# EasyEDA Pro project RT1064主板.eprj

# Schematic Schematic1
Board Name: Board1; Create Date: 2025-12-27; Page Name: P1; Project Name: 雪豹队 - 副本; Schematic Name: Schematic1; Update Date: 2025-12-29; Company: 嘉立创EDA; Page Size: A4; Version: V1.0
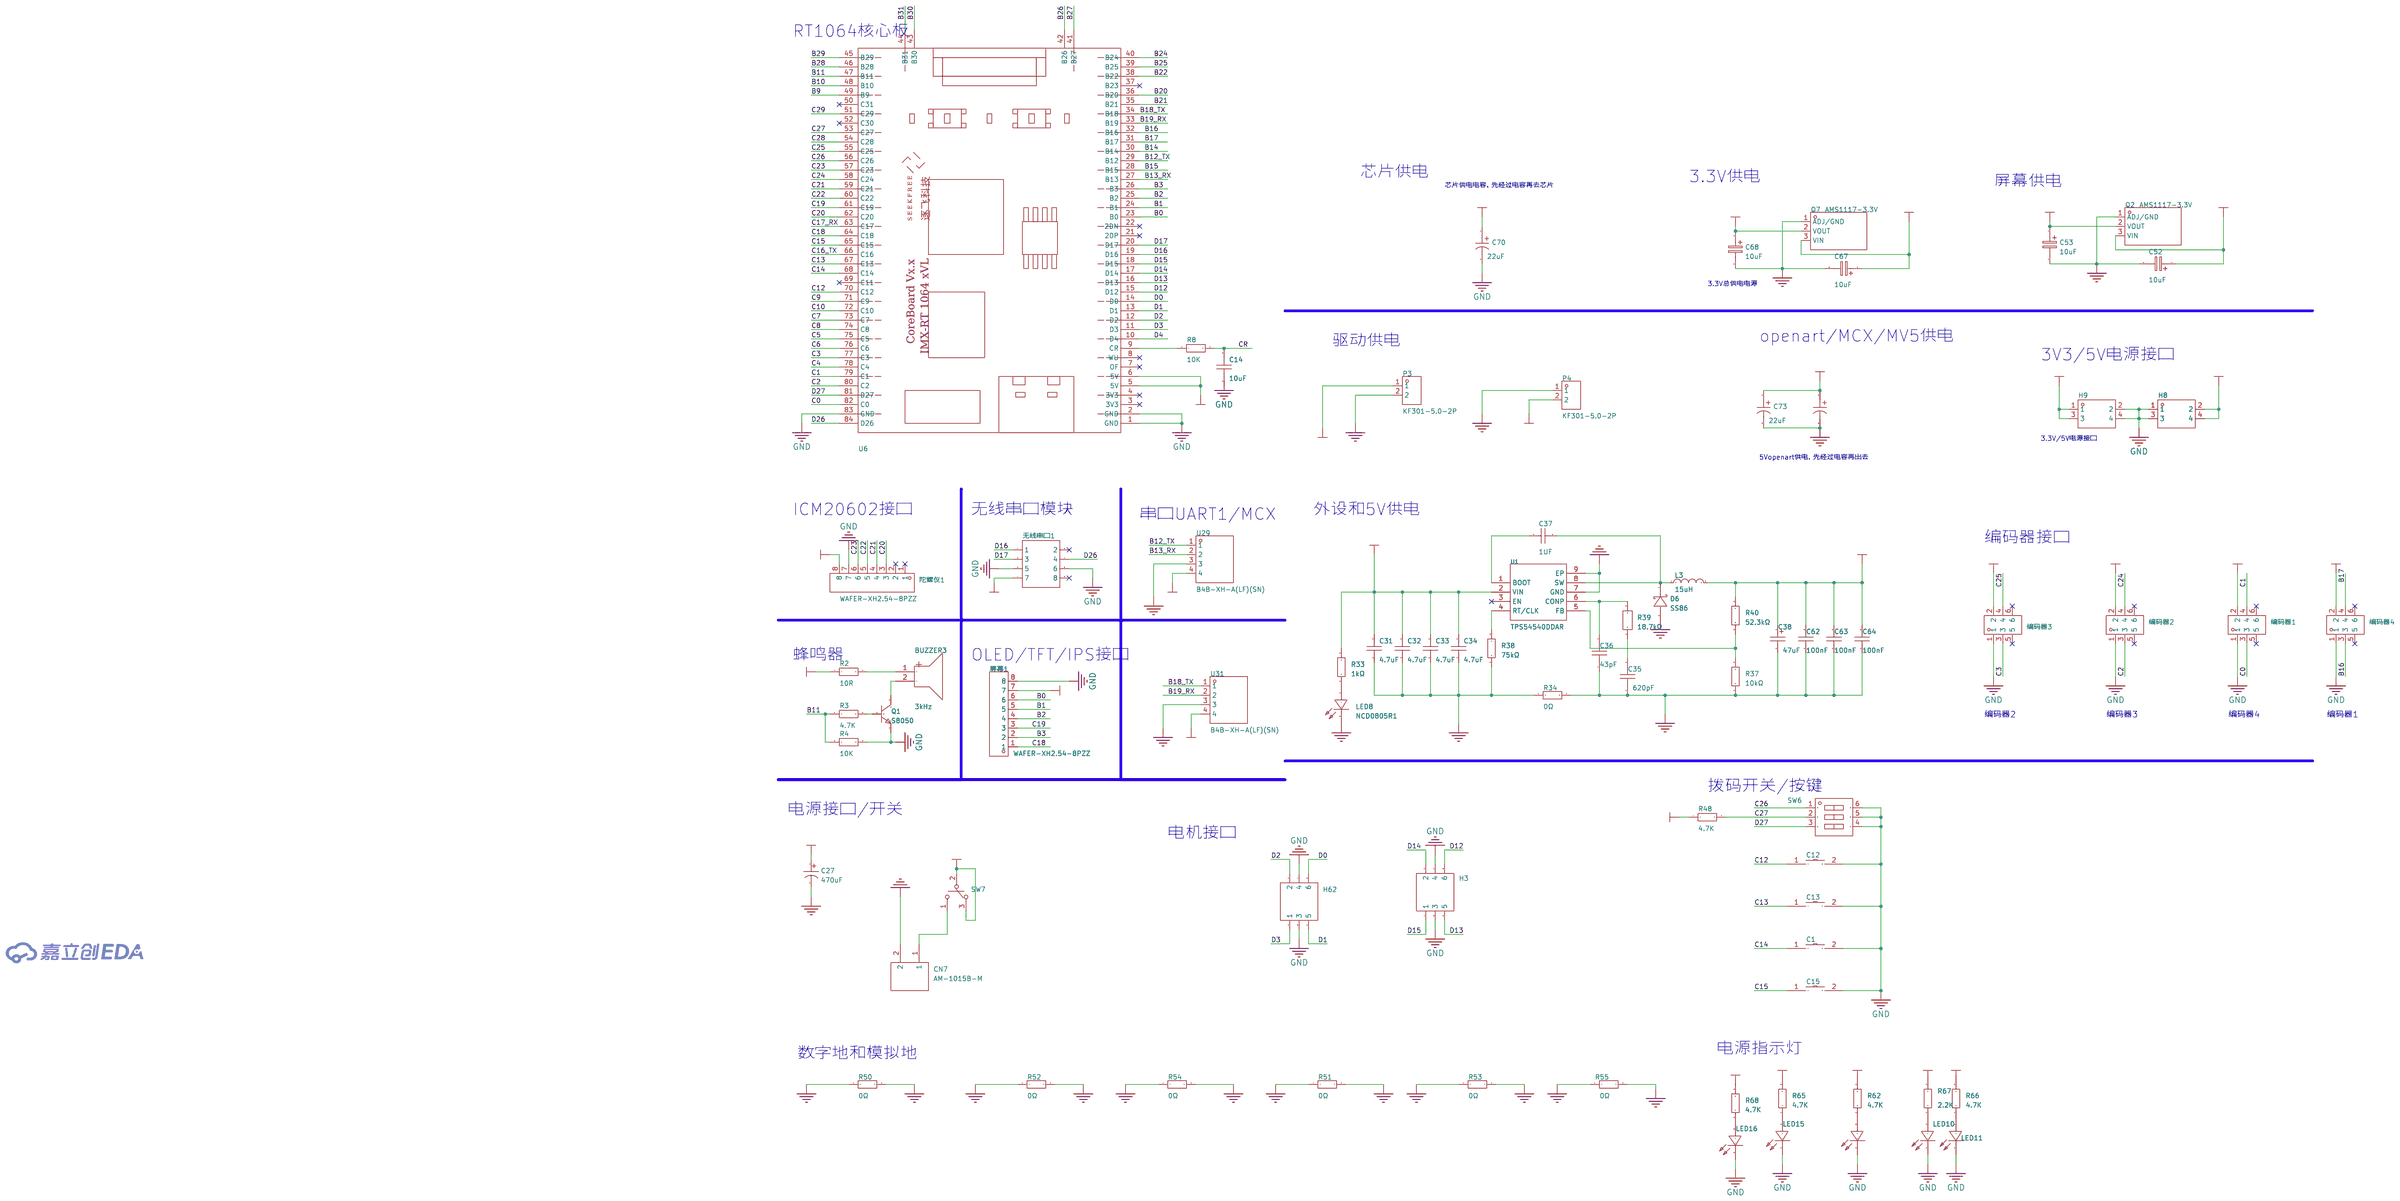
[diagram p0: schematic sheet]

## Parts
BUZZER3  3kHz  [BUZ-TH_BD9.0-P5.00-D0.6-FD]
C1  TS-1101-C-W  [SW-SMD_L6.0-W3.3-LS8.0]
C12  TS-1101-C-W  [SW-SMD_L6.0-W3.3-LS8.0]
C13  TS-1101-C-W  [SW-SMD_L6.0-W3.3-LS8.0]
C14  10uF  [C0805]
C15  TS-1101-C-W  [SW-SMD_L6.0-W3.3-LS8.0]
C27  470uF  [CAP-TH_BD10.0-P5.00-D1.0-FD]
C31  4.7uF  [C0805]
C32  4.7uF  [C0805]
C33  4.7uF  [C0805]
C34  4.7uF  [C0805]
C35  620pF  [C0805]
C36  43pF  [C0805]
C37  1UF  [C0805]
C38  47uF  [CAP-SMD_L3.5-W2.8-R-RD]
C52  10uF  [CAP-SMD_L3.5-W2.8-R-RD]
C53  10uF  [CAP-SMD_L3.5-W2.8-R-RD]
C62  100nF  [C0805]
C63  100nF  [C0805]
C64  100nF  [C0805]
C67  10uF  [CAP-SMD_L3.5-W2.8-R-RD]
C68  10uF  [CAP-SMD_L3.5-W2.8-R-RD]
C70  22uF  [CAP-SMD_L3.2-W1.6]
C73  22uF  [CAP-SMD_L3.2-W1.6]
C81  22uF  [CAP-SMD_L3.2-W1.6]
CN7  AM-1015B-M  [CONN-TH_AM-1015B-M]
D6  SS86  [SMC_L6.9-W5.9-LS7.9-RD]
H3  -  [HDR-TH_6P-P2.54-V-F-R2-C3-S2.54]
H8  -  [HDR-TH_4P-P2.54-V-M-R2-C2-S2.54-1]
H9  -  [HDR-TH_4P-P2.54-V-M-R2-C2-S2.54-1]
H62  -  [HDR-TH_6P-P2.54-V-F-R2-C3-S2.54]
L3  15uH  [IND-SMD_L7.1-W6.6]
LED8  NCD0805R1  [LED0805-R-RD]
LED10  NCD0805R1  [LED0805-RD]
LED11  NCD0805R1  [LED0805-RD]
LED12  NCD0805R1  [LED0805-RD]
LED15  NCD0805R1  [LED0805-RD]
LED16  NCD0805R1  [LED0805-RD]
P3  KF301-5.0-2P  [CONN-TH_P5.00_KF301-5.0-2P]
P4  KF301-5.0-2P  [CONN-TH_P5.00_KF301-5.0-2P]
Q1  S8050  [SOT-23-3_L2.9-W1.3-P1.90-LS2.4-BR]
Q2  AMS1117-3.3V  [SOT-89-3_L4.5-W2.5-P1.50-LS4.2-BR]
Q7  AMS1117-3.3V  [SOT-89-3_L4.5-W2.5-P1.50-LS4.2-BR]
R2  10R  [R0805]
R3  4.7K  [R0805]
R4  10K  [R0805]
R8  10K  [R0805]
R33  1kΩ  [R0805]
R34  0Ω  [R0805]
R37  10kΩ  [R0805]
R38  75kΩ  [R0805]
R39  18.7kΩ  [R0805]
R40  52.3kΩ  [R0805]
R48  4.7K  [R0805]
R50  0Ω  [R0805]
R51  0Ω  [R0805]
R52  0Ω  [R0805]
R53  0Ω  [R0805]
R54  0Ω  [R0805]
R55  0Ω  [R0805]
R62  4.7K  [R0805]
R65  4.7K  [R0805]
R66  4.7K  [R0805]
R67  2.2K  [R0805]
R68  4.7K  [R0805]
SW6  KF1001-03P-R0-GL-DFT-01B  [SW-TH_6P-L9.9-W9.0-P2.54-LS7.6]
SW7  MT-0-103-A101-M200-RS+PJ  [SW-TH_MT-0-103-A101-M200-RS]
U1  TPS54540DDAR  [SOIC-8_L4.9-W3.9-P1.27-LS6.0-BL-EP]
U6  -  [AUFE_RT1064]
U29  B4B-XH-A(LF)(SN)  [CONN-TH_B4B-XH-A-LF-SN]
U31  B4B-XH-A(LF)(SN)  [CONN-TH_B4B-XH-A-LF-SN]
屏幕1  WAFER-XH2.54-8PZZ  [CONN-TH_8P-P2.50-XH2.54-8P]
无线串口1  -  [HDR-TH_8P-P2.54-V-F-R2-C4-S2.54-1]
编码器1  67997-206HLF  [HDR-TH_6P-P2.54-V-M-R2-C3-S2.54-1]
编码器2  67997-206HLF  [HDR-TH_6P-P2.54-V-M-R2-C3-S2.54-1]
编码器3  67997-206HLF  [HDR-TH_6P-P2.54-V-M-R2-C3-S2.54-1]
编码器4  67997-206HLF  [HDR-TH_6P-P2.54-V-M-R2-C3-S2.54-1]
陀螺仪1  WAFER-XH2.54-8PZZ  [CONN-TH_8P-P2.50-XH2.54-8P]

## Library data of the parts
BUZZER3 = HNB09A03: 驱动方式:有源(内含驱动线路);构造类型:电磁式;频率:3kHz;声压(SPL):85dB@10cm;; LCSC Part Name: 电磁式有源一体蜂鸣器HNB09A03; Supplier Part: C96102; Manufacturer: 华能; Supplier Footprint: 插件,D=9mm; JLCPCB Part Class: 扩展库; Datasheet: https://atta.szlcsc.com/upload/public/pdf/source/20170522/1495448326172.pdf; Supplier: LCSC; Oscillator Circuit: 有源(内含驱动线路); Technology Type: 电磁式; Operating Voltage: 1.5V~4.5V; Current Consumption: 30mA; Sound Pressure Level (SPL): 85dB@10cm; Diameter (φD): 9mm; Height: 5.5mm; Operating Temperature: -20℃~+70℃
C1 C12 C13 C15 = TS-1101-C-W: 触点电流:50mA;额定电压(DC):12V;绝缘电阻:-;电路结构:单刀单掷;安装方式:立贴;按钮形状:矩形按钮;按钮/盖帽颜色:白色;带灯:无;作用力:260gf;机械寿命:50000;工作温度:-30℃~+85℃;开关长度:6mm;开关宽度:3.6mm;开关高度:2.5mm;带支架:否;; LCSC Part Name: TS-1101-C-W 一型3*6*2.5有白ZD b拉伸白色按键 卷装; Supplier Part: C318938; Manufacturer: XKB Connectivity(中国星坤); Supplier Footprint: SMD; JLCPCB Part Class: Extended Part; Datasheet: https://atta.szlcsc.com/upload/public/pdf/source/20200227/C318938_C2E53B1EEDE37D980A33616AC086DE53.pdf; Supplier: LCSC; Contact Current: 50mA; Voltage Rating (DC): 12V; Circuit: 单刀单掷; Mounting Style: 立贴; Actuator Style: 矩形按钮; Actuator/Cap Color: 白色; With Lamp: 无; Operating Force: 260gf; Mechanical Life: 50000; Operating Temperature: -30℃~+85℃; Switch Length: 6mm; Switch Width: 3.6mm; Switch Height: 2.5mm; Strike Gundam: 否
C14 = CAP_0805: Supplier Footprint: 0805
C27 = KM477M050G20RR0VH2FP0: 容值:470uF;精度:±20%;额定电压:50V;电容体直径:10mm;电容体长度:20mm;脚间距:5mm;工作寿命:2000hrs@105℃;; LCSC Part Name: 470uF ±20% 50V; Supplier Part: C34642; Manufacturer: CX(承兴); Supplier Footprint: 直插,D10xL20mm; JLCPCB Part Class: Extended Part; Datasheet: https://atta.szlcsc.com/upload/public/pdf/source/20211027/06D6BA3719C264B639DC286D935D03EA.pdf; Supplier: LCSC; Tolerance: ±20%; Rated Voltage: 50V; φD: 10mm; L: 20mm; Lead Spacing: 5mm; Lifetime @ Temp: 2000hrs@105℃
C31-C34 = CL21A475KAQNNNE: 容值:4.7uF;精度:±10%;额定电压:25V;材质(温度系数):X5R;; LCSC Part Name: 4.7uF ±10% 25V; Supplier Part: C1779; Manufacturer: SAMSUNG(三星); Supplier Footprint: 0805; JLCPCB Part Class: 基础库; Datasheet: https://atta.szlcsc.com/upload/public/pdf/source/20160218/1457707763339.pdf; Supplier: LCSC; Tolerance: ±10%; Voltage Rated: 25V; Temperature Coefficient: X5R
C35 = CC0805FRNPO9BN621: 容值:620pF;精度:±1%;额定电压:50V;材质(温度系数):NP0;; LCSC Part Name: 620pF ±1% 50V; Supplier Part: C541568; Manufacturer: YAGEO(国巨); Supplier Footprint: 0805; JLCPCB Part Class: 扩展库; Datasheet: https://atta.szlcsc.com/upload/public/pdf/source/20200615/C541568_5E136F40411BB8460285BCFF982D8614.pdf; Supplier: LCSC; Tolerance: ±1%; Voltage Rated: 50V; Temperature Coefficient: NP0
C36 = 0805CG430J500NT: 容值:43pF;精度:±5%;额定电压:50V;材质(温度系数):C0G;; LCSC Part Name: 43pF ±5% 50V; Supplier Part: C502147; Manufacturer: FH(风华); Supplier Footprint: 0805; JLCPCB Part Class: 扩展库; Datasheet: https://atta.szlcsc.com/upload/public/pdf/source/20200305/C486355_26A10D38EF8C2A5C37091D0039909270.pdf; Supplier: LCSC; Tolerance: ±5%; Voltage Rated: 50V; Temperature Coefficient: C0G
C37 = CC0805KRX7R9BB104: 容值:100nF;精度:±10%;额定电压:50V;材质(温度系数):X7R;; LCSC Part Name: 100nF ±10% 50V; Supplier Part: C49678; Manufacturer: YAGEO(国巨); Supplier Footprint: 0805; JLCPCB Part Class: 基础库; Datasheet: https://atta.szlcsc.com/upload/public/pdf/source/20180224/C181747_15194369449651363981.pdf; Supplier: LCSC; Tolerance: ±10%; Voltage Rated: 50V; Temperature Coefficient: X7R
C38 = CA45-B010K476T: 容值:47uF;精度:±10%;额定电压:10V;等效串联电阻:1Ω@100kHz;; LCSC Part Name: 47uF ±10% 10V; Supplier Part: C123253; Manufacturer: 湘怡中元/湘江; Supplier Footprint: CASE-B-3528; JLCPCB Part Class: 扩展库; Datasheet: https://atta.szlcsc.com/upload/public/pdf/source/20181017/C123253_E44F021CD80332E438026884F943F9F2.pdf; Supplier: LCSC; Tolerance: ±10%; Rated Voltage: 10V; Equivalent Series Resistance(ESR): 1Ω@100kHz; Operating Temperature: -55℃~+125℃
C52 C53 C67 C68 = CA45-B-16V-10μF-K: 容值:10uF;精度:±10%;额定电压:16V;等效串联电阻:2.8Ω@100kHz;; LCSC Part Name: 10uF ±10% 16V; Supplier Part: C503899; Manufacturer: TORCH(火炬); Supplier Footprint: CASE-B-3528; JLCPCB Part Class: 扩展库; Datasheet: https://atta.szlcsc.com/upload/public/pdf/source/20200527/C503899_E68A547A52C2BA3860090FD06476D5DC.pdf; Supplier: LCSC; Tolerance: ±10%; Rated Voltage: 16V; Equivalent Series Resistance(ESR): 2.8Ω@100kHz; Operating Temperature: -55℃~+125℃
C62-C64 = 0805B104K500NT: 容值:100nF;精度:±10%;额定电压:50V;材质(温度系数):X7R;; LCSC Part Name: 100nF ±10% 50V; Supplier Part: C38141; Manufacturer: FH(风华); Supplier Footprint: 0805; JLCPCB Part Class: 扩展库; Datasheet: https://atta.szlcsc.com/upload/public/pdf/source/20200305/C486355_26A10D38EF8C2A5C37091D0039909270.pdf; Supplier: LCSC; Tolerance: ±10%; Voltage Rated: 50V; Temperature Coefficient: X7R
C70 C73 C81 = CA45-A-16V-22uF-K: 容值:22uF;精度:±10%;额定电压:16V;等效串联电阻:6Ω@100kHz;; LCSC Part Name: 22uF ±10% 16V; Supplier Part: C782264; Manufacturer: CEC(振华新云); Supplier Footprint: CASE-A-3216; JLCPCB Part Class: 扩展库; Datasheet: https://atta.szlcsc.com/upload/public/pdf/source/20200909/C782264_D6D9C4EF3B25E81633C26A9294FBB820.pdf; Supplier: LCSC; Tolerance: ±10%; Rated Voltage: 16V; Equivalent Series Resistance(ESR): 6Ω@100kHz; Operating Temperature: -55℃~+125℃
CN7 = AM-1015B-M: 类别:-;类型1:-;; LCSC Part Name: AMASS(艾迈斯)电源连接器公头AM-1015B-M; Supplier Part: C90631; Manufacturer: AMASS(艾迈斯); JLCPCB Part Class: 扩展库; Datasheet: https://atta.szlcsc.com/upload/public/pdf/source/20161217/1481939174683.pdf; Supplier: LCSC; Brand: 艾迈斯; Type: T行插头; RatedVoltage: DC 500V; InterfaceType: 双公头; MetalMaterial: 铜镀金; InsulationMaterial: PA; RatedCurrent: 25A; RecommendedWireGauge: 12AWG; FlameRetardantGrade: UL94 V0; contact resistance: 0.45mΩ
D6 = SS86: 二极管配置:独立式;正向压降(Vf):700mV@8A;直流反向耐压(Vr):60V;平均整流电流(Io):8A;; LCSC Part Name: 电压:60V 电流:8A; Supplier Part: C698827; Manufacturer: YANGJIE(扬杰); Supplier Footprint: SMC(DO-214AB); JLCPCB Part Class: 扩展库; Datasheet: https://atta.szlcsc.com/upload/public/pdf/source/20200709/C698826_5E937841B5131ACF209993117D465D40.pdf; Supplier: LCSC; Diode Configuration: 独立式; Forward Voltage (Vf@If): 700mV@8A; Reverse Voltage (Vr): 60V; Average Rectified Current (Io): 8A; Reverse Leakage Current (Ir): 200uA@60V
H3 H62 = HDR-F_2.54_2x3: Supplier Part: C92272; Supplier Footprint: 插件
H8 H9 = HDR-M_2.54_2x2: Supplier Part: C160338; Supplier Footprint: 插件,P=2.54mm
L3 = PSPMAQ0605H-150M-ANP: 电感值:15uH;精度:±20%;额定电流:3.5A;饱和电流(Isat):6A;; LCSC Part Name: 15uH ±20% 6A; Supplier Part: C726343; Manufacturer: PROD(谱罗德); Supplier Footprint: SMD,6.6x7.1mm; JLCPCB Part Class: 扩展库; Datasheet: https://atta.szlcsc.com/upload/public/pdf/source/20200923/C726334_6740F679044ED6FAED7178765ABA7BEE.pdf; Supplier: LCSC; Tolerance: ±20%; Rated Current: 3.5A; Saturation Current (Isat): 6A; DC Resistance (DCR): 87mΩ; Ratings: AEC-Q200
LED8 = NCD0805R1: 灯头类型:-;发光颜色:红色;正向电压(VF):1.6V~2.6V;功率:65mW;正向电流:20mA;主波长:615nm~630nm;二极管配置:独立二极管;透镜颜色:无色透明;色温:-;发光强度:67mcd~195mcd;发光角度:130°;载带方式:-;工作温度:-30℃~+85℃;; Supplier Part: C84256; Manufacturer: 国星光电; Supplier Footprint: 0805; JLCPCB Part Class: 基础库; Datasheet: https://atta.szlcsc.com/upload/public/pdf/source/20200820/C84256_F0A75A43B3EAD75808600A0514C76B99.pdf; Supplier: LCSC; Emitted Color: 红色; Forward Voltage (VF): 1.6V~2.6V; Power Dissipation: 65mW; Forward Current: 20mA; Dominant Wavelength: 615nm~630nm; Diode Configuration: 独立二极管; Lens Color: 无色透明; Luminous Intensity: 67mcd~195mcd; Viewing Angle: 130°; Operating Temperature: -30℃~+85℃
LED10-LED12 LED15 LED16 = NCD0805R1: 发光颜色:红灯;; LCSC Part Name: 红灯; Supplier Part: C84256; Manufacturer: 国星光电; Supplier Footprint: 0805; JLCPCB Part Class: Basic Part; Datasheet: https://atta.szlcsc.com/upload/public/pdf/source/20200820/C84256_F0A75A43B3EAD75808600A0514C76B99.pdf; Supplier: LCSC; Emitted Color: 红灯
P3 P4 = KF301-5.0-2P: 结构:1x2P;间距:5mm;颜色:蓝色;安装方式:直插;额定电流:17A;额定电压:250V;排数:1;线规 - AWG:14~22;线规 - 平方毫米:1.5;每排PIN数:2;工作温度范围:-30℃~+120℃;; LCSC Part Name: 5mm 1x2P 排数:1 每排P数:2 直插; Supplier Part: C474881; Manufacturer: KEFA(科发); Supplier Footprint: 插件,P=5mm; JLCPCB Part Class: 扩展库; Datasheet: https://atta.szlcsc.com/upload/public/pdf/source/20230317/03A5B5FC229D6F9225E8F51DA1A4E80A.pdf; Supplier: LCSC; Structure: 1x2P; Pitch: 5mm; Color: 蓝色; Mounting Style: 直插; Current Rating (Max): 17A; Voltage Rating (Max): 250V; Number of Pins: 2P; Number of Rows: 1; Wire Gauge - AWG: 14~22; Wire Gauge - mm2: 1.5; Number of PINs Per Row: 2; Operating Temperature Range: -30℃~+120℃
Q1 = S8050_C2762211: 晶体管类型:NPN;集射极击穿电压(Vceo):25V;集电极电流(Ic):500mA;功率(Pd):300mW;集电极-发射极饱和电压(VCE(sat)@Ic,Ib):600mV@500mA,50mA;直流电流增益(hFE@Ic,Vce):120@50mA,1V;特征频率(fT):150MHz;工作温度:-55℃~+150℃@(Tj);; Supplier Part: C2762211; Manufacturer: 晶导微电子; Supplier Footprint: SOT-23; JLCPCB Part Class: Extended Part; Datasheet: https://atta.szlcsc.com/upload/public/pdf/source/20210521/C2762211_5AC5D762C14CC7F013712CBEE509B0DC.pdf; Supplier: LCSC; Transistor Type: NPN; Collector-Emitter Breakdown Voltage (Vceo): 25V; Collector Current (Ic): 500mA; Power Dissipation (Pd): 300mW; Collector-Emitter Saturation Voltage (VCE(sat)@Ic,Ib): 600mV@500mA,50mA; DC Current Gain (hFE@Ic,Vce): 120@50mA,1V; Transition Frequency (fT): 150MHz; Operating Temperature: -55℃~+150℃@(Tj)
Q2 Q7 = AMS1117-3.3V_C5120796: 输出类型:固定;最大输入电压:18V;输出电压:3.3V;最大输出电流:1A;输出极性:正极;; LCSC Part Name: 输入18V 输出3.3V 1A; Supplier Part: C5120796; Manufacturer: MSKSEMI(美森科); Supplier Footprint: SOT-89; JLCPCB Part Class: 扩展库; Datasheet: https://atta.szlcsc.com/upload/public/pdf/source/20231123/6117526697EB8BF6175FDEEBA0877266.pdf; Supplier: LCSC; Output Type: 固定; Maximum Input Voltage: 18V; Output Voltage: 3.3V; MAX Output Current: 1A; Dropout Voltage: 1.4V@(1A); standby current: 12mA; Operating Temperature: 0℃~+125℃; Output Polarity: 正极; Number of Outputs: 1
R2-R4 R8 R34 R48 R50-R55 R62 R65-R68 = Res_0805: Supplier Footprint: 0805
R33 = 0805W8F1001T5E: 阻值:1kΩ;精度:±1%;功率:125mW;温度系数:±100ppm/℃;电阻类型:厚膜电阻;; LCSC Part Name: 1kΩ ±1% 125mW 厚膜电阻; Supplier Part: C17513; Manufacturer: UNI-ROYAL(厚声); Supplier Footprint: 0805; JLCPCB Part Class: 基础库; Datasheet: https://atta.szlcsc.com/upload/public/pdf/source/20200306/C422600_1E6D84923E4A46A82E41ADD87F860B5C.pdf; Supplier: LCSC; Tolerance: ±1%; Power(Watts): 125mW; Overload Voltage (Max): 150V; Temperature Coefficient: ±100ppm/℃; Type: 厚膜电阻; Operating Temperature Range: -55℃~+155℃
R37 = 0805W8F1002T5E_C17414: 阻值:10kΩ;精度:±1%;功率:125mW;温度系数:±100ppm/℃;电阻类型:厚膜电阻;; LCSC Part Name: 10kΩ ±1% 125mW 厚膜电阻; Supplier Part: C17414; Manufacturer: UNI-ROYAL(厚声); Manufacturer Part: 0805W8F1002T5E; Supplier Footprint: 0805; JLCPCB Part Class: 基础库; Datasheet: https://atta.szlcsc.com/upload/public/pdf/source/20200306/C422600_1E6D84923E4A46A82E41ADD87F860B5C.pdf; Supplier: LCSC; Tolerance: ±1%; Power(Watts): 125mW; Overload Voltage (Max): 150V; Temperature Coefficient: ±100ppm/℃; Type: 厚膜电阻; Operating Temperature Range: -55℃~+155℃
R38 = 0805W8F7502T5E: 电阻类型:厚膜电阻;阻值:75kΩ;精度:±1%;功率:125mW;最大工作电压:150V;温度系数:±100ppm/℃;; LCSC Part Name: 75kΩ ±1% 125mW 厚膜电阻; Supplier Part: C17819; Manufacturer: UNI-ROYAL(厚声); Supplier Footprint: 0805; JLCPCB Part Class: 扩展库; Datasheet: https://atta.szlcsc.com/upload/public/pdf/source/20200306/C422600_1E6D84923E4A46A82E41ADD87F860B5C.pdf; Supplier: LCSC; Type: 厚膜电阻; Tolerance: ±1%; Power(Watts): 125mW; Overload Voltage (Max): 150V; Temperature Coefficient: ±100ppm/℃; Operating Temperature Range: -55℃~+155℃
R39 = RC0805FR-0718K7L: 电阻类型:厚膜电阻;阻值:18.7kΩ;精度:±1%;功率:125mW;最大工作电压:150V;温度系数:±100ppm/℃;; LCSC Part Name: 厚膜电阻 18.7kΩ ±1% 125mW; Supplier Part: C273880; Manufacturer: YAGEO(国巨); Supplier Footprint: 0805; JLCPCB Part Class: 扩展库; Datasheet: https://atta.szlcsc.com/upload/public/pdf/source/20191125/C364360_EA870FADD46A2AD4DBE56DD50D360B3E.pdf; Supplier: LCSC; Type: 厚膜电阻; Tolerance: ±1%; Power(Watts): 125mW; Overload Voltage (Max): 150V; Temperature Coefficient: ±100ppm/℃; Operating Temperature Range: -55℃~+155℃
R40 = RS-05K5232FT: 电阻类型:厚膜电阻;阻值:52.3kΩ;精度:±1%;功率:125mW;最大工作电压:150V;温度系数:±100ppm/℃;; LCSC Part Name: 厚膜电阻 52.3kΩ ±1% 125mW; Supplier Part: C322506; Manufacturer: FH(风华); Supplier Footprint: 0805; JLCPCB Part Class: 扩展库; Datasheet: https://atta.szlcsc.com/upload/public/pdf/source/20140616/1457707091974.pdf; Supplier: LCSC; Type: 厚膜电阻; Tolerance: ±1%; Power(Watts): 125mW; Overload Voltage (Max): 150V; Temperature Coefficient: ±100ppm/℃; Operating Temperature Range: -55℃~+155℃
SW6 = KF1001-03P-R0-GL-DFT-01B: 拨码开关 平拨，凸起式 单刀单掷  3  2.54mm; LCSC Part Name: 拨码开关; Supplier Part: C976325; Manufacturer: 凯峰; Supplier Footprint: 插件; JLCPCB Part Class: Extended Part; Datasheet: https://atta.szlcsc.com/upload/public/pdf/source/20201228/C976325_7DE6B97091F92900F04675A87B4D1E02.pdf; Supplier: LCSC
SW7 = MT-0-103-A101-M200-RS+PJ: 额定电流:5A;额定电压(AC):125V;电路结构:单刀双掷;钮柄形状:圆柱钮柄;引脚样式:焊片;安装方式:直插;工作温度:-25℃~+85℃;开关长度:13mm;开关宽度:8mm;开关高度:28.6mm;; LCSC Part Name: 小型钮子三脚三档(五件套); Supplier Part: C1788493; Manufacturer: YUEN FUNG(源丰); Supplier Footprint: 插件; JLCPCB Part Class: Extended Part; Datasheet: https://atta.szlcsc.com/upload/public/pdf/source/20201225/C1788493_608759AD4D4A20FF90A03E3E3321FD91.pdf; Supplier: LCSC; Contact Current: 5A; Voltage Rating (AC): 125V; Circuit: 单刀双掷; Actuator Type: 圆柱钮柄; Pin Style: 焊片; Mounting Style: 直插; Operating Temperature: -25℃~+85℃; Switch Length: 13mm; Switch Width: 8mm; Switch Height: 28.6mm
U1 = TPS54540DDAR: 功能类型:降压型;输出类型:可调;输入电压:4.5V~42V;输出电压:800mV~41.1V;输出电流(最大值):5A;; Supplier Part: C95286; Manufacturer: TI(德州仪器); Supplier Footprint: SOP-8-EP; JLCPCB Part Class: 扩展库; Datasheet: https://www.ti.com/cn/lit/gpn/tps54540; Supplier: LCSC; Function: 降压型; Synchronous Rectification: 否; Output Type: 可调; Number of Outputs: 1; Topology: 降压式; Input Voltage: 4.5V~42V; Output Voltage: 800mV~41.1V; Output Current (Max): 5A; Switching Frequency: 2.5MHz; Operating Temperature: -40℃~+150℃@(TJ)
U6 = RT1064
U29 U31 = B4B-XH-A(LF)(SN): 插针结构:1x4P;间距:2.5mm;安装方式:直插;参考系列:XH;总PIN数:4P;排数:1;每排PIN数:4;行距:-;额定电流:3A;触头材质:黄铜;触头镀层:锡;工作温度范围:-25℃~+85℃;; LCSC Part Name: 1x4P 间距:2.5mm 直插 系列:XH; Supplier Part: C144395; Manufacturer: JST; Supplier Footprint: 插件,P=2.5mm; JLCPCB Part Class: 扩展库; Datasheet: https://atta.szlcsc.com/upload/public/pdf/source/20180928/C265283_F9DFEEBDB2CF642B6BDFAB4B77BD2680.pdf; Supplier: LCSC; Pins Structure: 1x4P; Pitch: 2.5mm; Mounting Style: 直插; Reference Series: XH; Number of Pins: 4P; Number of Rows: 1; Number of PINs Per Row: 4; Current Rating (Max): 3A; Contact Material: 黄铜; Contact Plating: 锡; Operating Temperature Range: -25℃~+85℃; Rated Voltage (Max): 250V; Plastic Material: PA66; Flame Retardant Rating: UL94V-0; Supplementary Features: 打K脚; Z-Height of the Board: 7mm; X-Length of Bottom Edge on Board (Spacing Line): 12.4mm; Y-Width of Bottom Edge on Board: 5.75mm
屏幕1 陀螺仪1 = WAFER-XH2.54-8PZZ: 插针结构:1x8P;间距:2.54mm;安装方式:直插;总PIN数:8P;排数:1;每排PIN数:8;额定电流:2A;工作温度范围:-25℃~+85℃;; LCSC Part Name: XH 2.54mm 1x8P 直插; Supplier Part: C5359636; Manufacturer: XUNPU(讯普); Supplier Footprint: 插件,P=2.54mm; JLCPCB Part Class: 扩展库; Datasheet: https://atta.szlcsc.com/upload/public/pdf/source/20230221/5D6483F9C7001DB87CFCFC787E1DC139.pdf; Supplier: LCSC; Pins Structure: 1x8P; Pitch: 2.54mm; Mounting Style: 直插; Number of Pins: 8P; Number of Rows: 1; Number of PINs Per Row: 8; Current Rating (Max): 2A; Operating Temperature Range: -25℃~+85℃
无线串口1 = HDR-F_2.54_2x4: Supplier Part: C92271; Supplier Footprint: 插件
编码器1-编码器4 = 67997-206HLF: 排数:双排;总PIN位数:-;间距:2.54mm;插针结构:-;行距:2.54mm;安装类型:直插;圆针/方针:方针;额定电流:-;额定电压:-;配合针长度:-;塑高:2.54mm;触头材质:磷青铜;触头镀层:-;颜色:黑色;; LCSC Part Name: 2.54mm 直插 方针; Supplier Part: C236051; Manufacturer: Amphenol; Supplier Footprint: 插件,P=2.54mm; JLCPCB Part Class: Extended Part; Datasheet: https://atta.szlcsc.com/upload/public/pdf/source/20180628/C236051_0392958A7E48808CEC9642DF7CCB05DE.pdf; Supplier: LCSC; Number of Rows: 双排; Pitch: 2.54mm; Row Spacing: 2.54mm; Mounting Type: 直插; Circluar Pins/Square Pins: 方针; Insulation Height: 2.54mm; Contact Material: 磷青铜; Color: 黑色

## Nets
3V3: C68.1 H8.2 H8.4 Q7.2(VOUT) R2.1 R48.1 编码器1.2 编码器2.2 编码器3.2 编码器4.2
3V31: C53.1 Q2.2(VOUT) R67.2 屏幕1.7
GND: C1.2 C12.2 C13.2 C14.1 C15.2 C35.1 C36.1 C38.2 C52.2 C53.2 C62.1 C63.1 C64.1 C67.2 C68.2 C70.2 C73.2 C81.2 D6.2(A) H3.3 H3.4 H8.1 H8.3 H9.2 H9.4 H62.3 H62.4 LED10.1(-) LED11.1(-) LED12.1(-) LED15.1(-) LED16.1(-) Q1.2(E) Q2.1(ADJ/GND) Q7.1(ADJ/GND) R4.2 R34.2 R37.1 R50.2 R51.2 R52.2 R53.2 R54.2 R55.2 SW6.4(PIN4) SW6.5(PIN5) SW6.6(PIN6) U1.7(GND) U1.9(EP) U6.1(GND) U6.2(GND) U6.83(GND) U29.3 U31.3 屏幕1.8 无线串口1.5 无线串口1.6 编码器1.1 编码器2.1 编码器3.1 编码器4.1 陀螺仪1.7
GNDBAT: C27.2 C31.1 C32.1 C33.1 C34.1 CN7.2 LED8.2(-) P3.2 P4.1 R34.1 R38.1 R50.1 R51.1 R52.1 R53.1 R54.1 R55.1
VCC5V: C38.1 C52.1 C62.2 C63.2 C64.2 C67.1 C70.1 C73.1 C81.1 H9.1 H9.3 L3.2 Q2.3(VIN) Q7.3(VIN) R40.1 R62.2 R65.2 R66.2 R68.2 U6.5(5V) U6.6(5V) U29.4 U31.4 无线串口1.7 陀螺仪1.8
VCCBAT: C27.1 C31.2 C32.2 C33.2 C34.2 P3.1 P4.2 R33.2 SW7.2 SW7.3 U1.2(VIN)
B0: U6.23(B0) 屏幕1.6
B1: U6.24(B1) 屏幕1.5
B2: U6.25(B2) 屏幕1.4
B3: U6.26(B3) 屏幕1.2
B9: U6.49(B9)
B10: U6.48(B10)
B11: R3.1 R4.1 U6.47(B11)
B12_TX: U6.29(B12) U29.1
B13_RX: U6.27(B13) U29.2
B14: U6.30(B14)
B15: U6.28(B15)
B16: U6.32(B16) 编码器4.3
B17: U6.31(B17) 编码器4.4
B18_TX: U6.34(B18) U31.1
B19_RX: U6.33(B19) U31.2
B20: U6.36(B20)
B21: U6.35(B21)
B22: U6.38(B22)
B24: U6.40(B24)
B25: U6.39(B25)
B26: U6.42(B26)
B27: U6.41(B27)
B28: U6.46(B28)
B29: U6.45(B29)
B30: U6.43(B30)
B31: U6.44(B31)
C0: U6.82(C0) 编码器1.3
C1: U6.79(C1) 编码器1.4
C2: U6.80(C2) 编码器2.3
C3: U6.77(C3) 编码器3.3
C4: U6.78(C4)
C5: U6.75(C5)
C6: U6.76(C6)
C7: U6.73(C7)
C8: U6.74(C8)
C9: U6.71(C9)
C10: U6.72(C10)
C12: C12.1 U6.70(C12)
C13: C13.1 U6.67(C13)
C14: C1.1 U6.68(C14)
C15: C15.1 U6.65(C15)
C16_TX: U6.66(C16)
C17_RX: U6.63(C17)
C18: U6.64(C18) 屏幕1.1
C19: U6.61(C19) 屏幕1.3
C20: U6.62(C20) 陀螺仪1.3
C21: U6.59(C21) 陀螺仪1.4
C22: U6.60(C22) 陀螺仪1.5
C23: U6.57(C23) 陀螺仪1.6
C24: U6.58(C24) 编码器2.4
C25: U6.55(C25) 编码器3.4
C26: SW6.1(PIN1) U6.56(C26)
C27: R48.2 SW6.2(PIN2) U6.53(C27)
C28: U6.54(C28)
C29: U6.51(C29)
CR: C14.2 R8.2
D0: H62.6 U6.14(D0)
D1: H62.5 U6.13(D1)
D2: H62.2 U6.12(D2)
D3: H62.1 U6.11(D3)
D4: U6.10(D4)
D12: H3.6 U6.15(D12)
D13: H3.5 U6.16(D13)
D14: H3.2 U6.17(D14)
D15: H3.1 U6.18(D15)
D16: U6.19(D16) 无线串口1.1
D17: U6.20(D17) 无线串口1.3
D26: U6.84(D26) 无线串口1.4
D27: SW6.3(PIN3) U6.81(D27)
$1N4191: Q1.1(B) R3.2
$1N4192: BUZZER3.2(-) Q1.3(C)
$1N4364: BUZZER3.1(+) R2.2
$1N4371: R38.2 U1.4(RT/CLK)
$1N4372: C37.1 U1.1(BOOT)
$1N4373: C37.2 D6.1(C) L3.1 U1.8(SW)
$1N4374: C36.2 R39.2 U1.6(CONP)
$1N4375: C35.2 R39.1
$1N4376: R37.2 R40.2 U1.5(FB)
$1N4399: R8.1 U6.9(CR)
$1N4411: LED8.1(+) R33.1
$1N4451: LED12.2(+) R62.1
$1N4463: LED15.2(+) R65.1
$1N4464: LED11.2(+) R66.1
$1N4466: LED10.2(+) R67.1
$1N4492: LED16.2(+) R68.1
$1N4494: CN7.1 SW7.1

Not connected (* = marked no-connect by the designer): U1 3(EN)*; U6 3(3V3)* 4(3V3)* 7(OF)* 8(WU)* 21(2DP)* 22(2DN)* 37(B23)* 50(C31)* 52(C30)* 69(C11)*; 无线串口1 2* 8*; 编码器1 5* 6*; 编码器2 5* 6*; 编码器3 5* 6*; 编码器4 5* 6*; 陀螺仪1 1* 2*

## Notes on the sheet
- RT1064核心板
- 芯片供电
- 3.3V供电
- 芯片供电电容，先经过电容再去芯片
- 屏幕供电
- 3.3V总供电电源
- openart/MCX/MV5供电
- 驱动供电
- 3V3/5V电源接口
- 3.3V/5V电源接口
- 5Vopenart供电，先经过电容再出去
- ICM20602接口
- 无线串口模块
- 外设和5V供电
- 串口UART1/MCX
- 编码器接口
- 蜂鸣器
- OLED/TFT/IPS接口
- 编码器2
- 编码器3
- 编码器4
- 编码器1
- 拨码开关/按键
- 电源接口/开关
- 电机接口
- 数字地和模拟地
- 电源指示灯

# Board PCB1
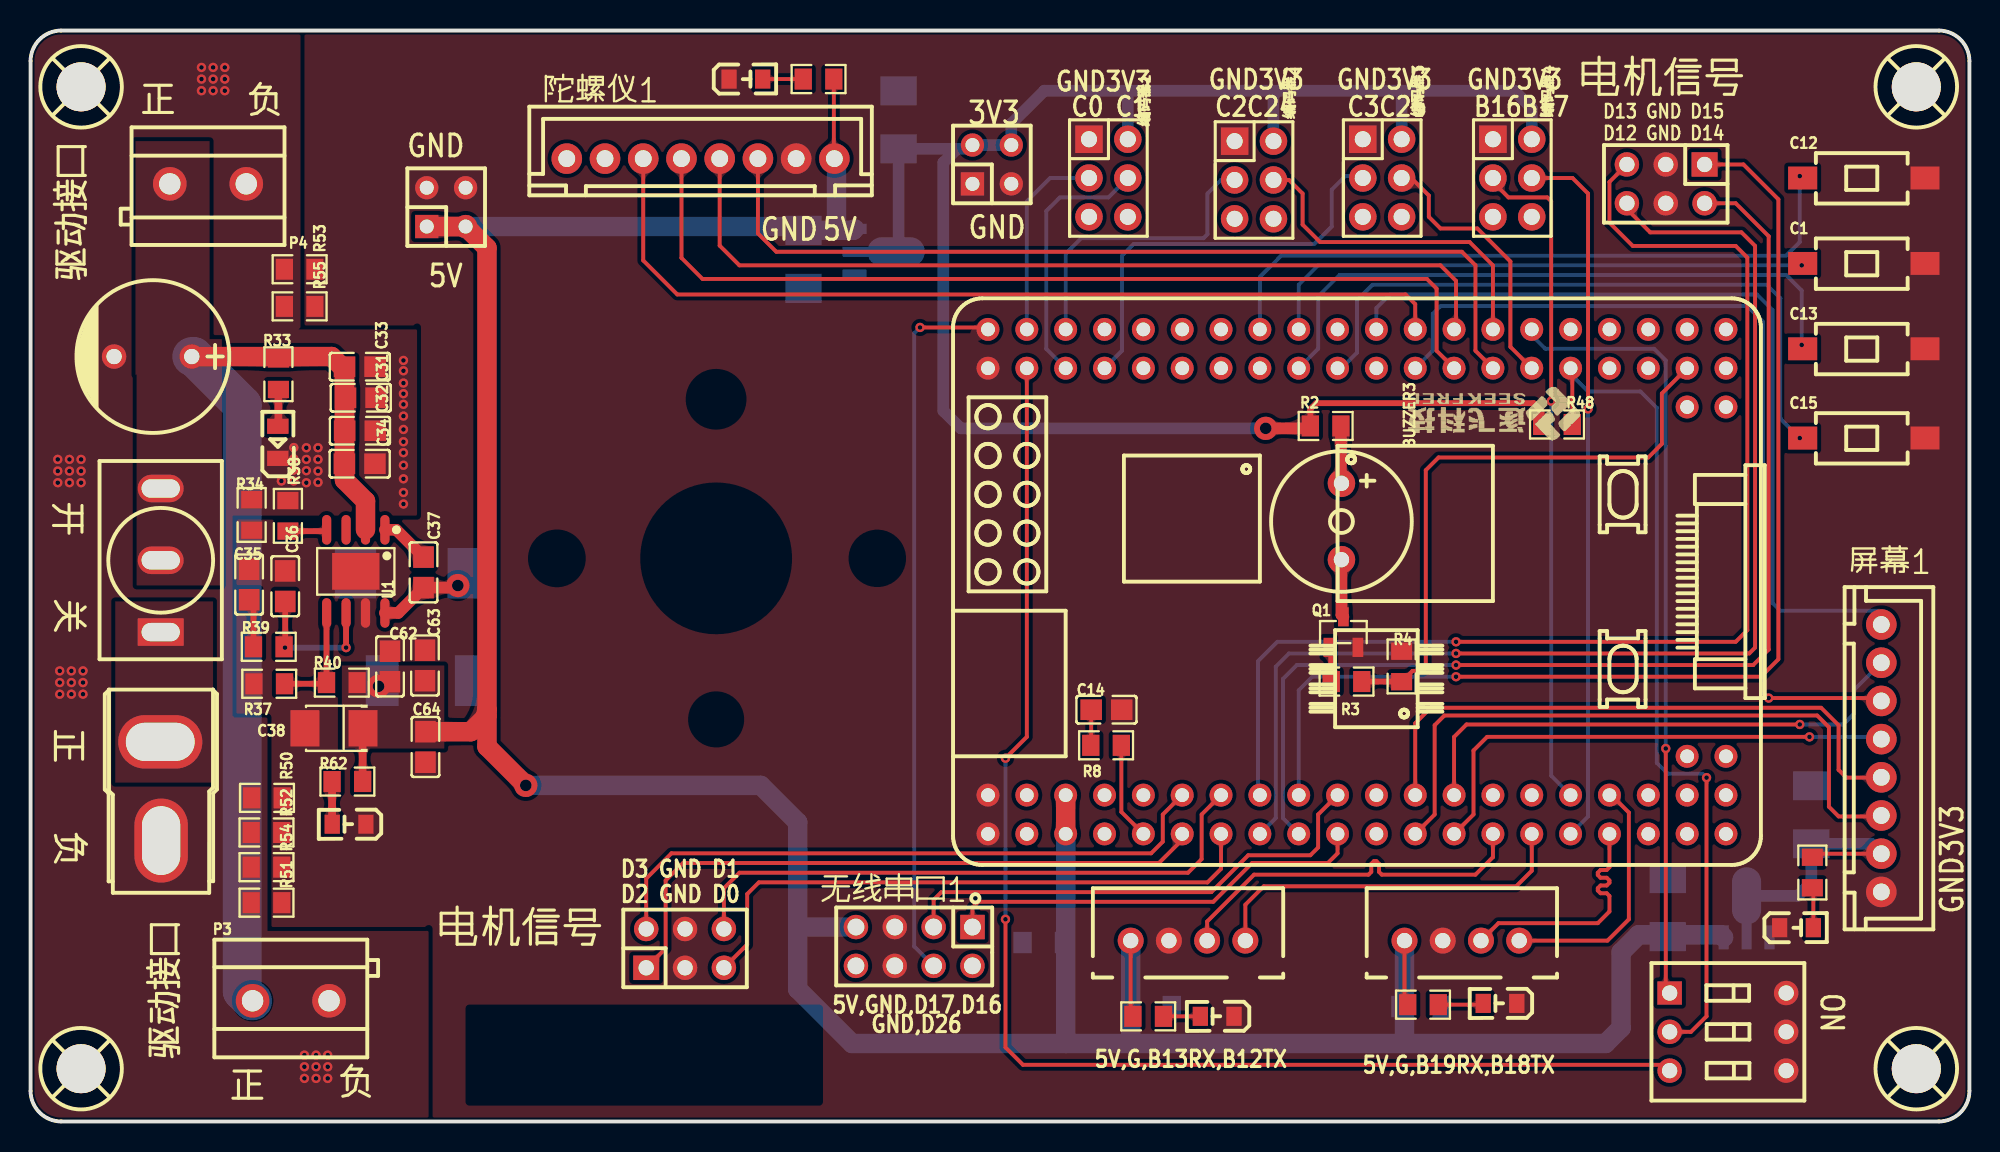
[diagram p1: board, top side]
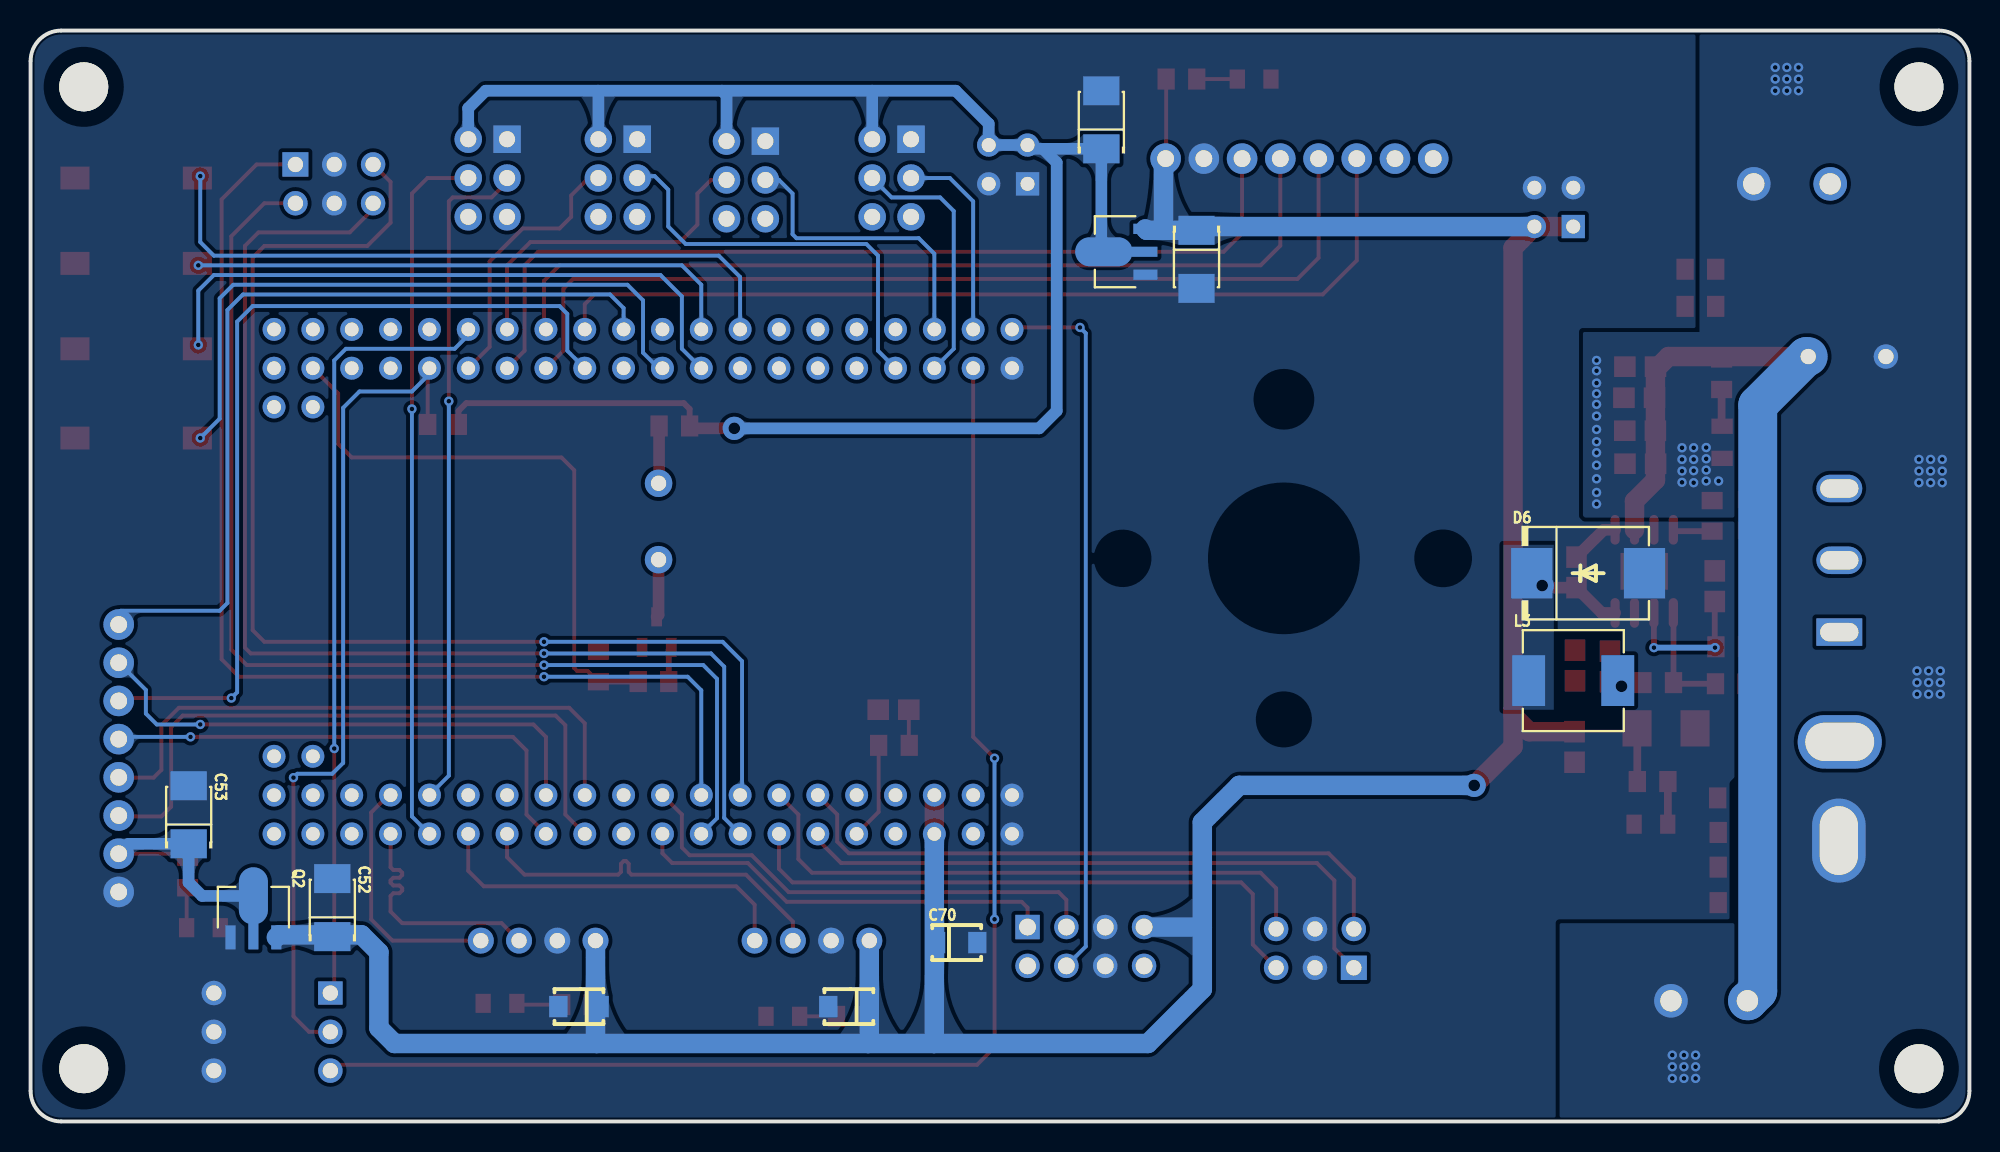
[diagram p2: board, bottom side, seen from below]

Outline 126.79 x 71.4 mm; copper layers: Top Layer, Bottom Layer. Coordinates in mm from the lower left corner of the outline.
Outline path: 0,69.4 0,2 arc(0.59,0.59) 2,0 124.79,0 arc(126.21,0.59) 126.79,2 126.79,69.4 arc(126.21,70.81) 124.79,71.4 2,71.4 arc(0.59,70.81) 0,69.4
Stack: Top Layer 0.035mm / Dielectric1 1.51mm FR4 er 4.5 / Bottom Layer 0.035mm

## Design rules (mm)
template: 自定义配置
spacing copperThickness1oz (default): track to track 0.102, other pairs 0.152 to 0.3
spacing copperThickness2oz: track to track 0.203, other pairs 0.152 to 0.3
track width copperThickness1oz (default): min 0.127, default 0.254, max 2.54
track width copperThickness2oz: min 0.203, default 0.254, max 2.54
differential pair differentialPair (default): width min 0.127, default 0.254, max 2.54; gap min 0.152, default 0.152
via viaSize (default): diameter min 0.5, default 0.61, max 10; hole min 0.3, default 0.305, max 6.3

## Placement (name value [footprint] x y rotation side)
BUZZER3  3kHz  [BUZ-TH_BD9.0-P5.00-D0.6-FD]  85.72 39.27 270 top
C1  TS-1101-C-W  [SW-SMD_L6.0-W3.3-LS8.0]  119.89 56.16 0 top
C12  TS-1101-C-W  [SW-SMD_L6.0-W3.3-LS8.0]  119.89 61.74 0 top
C13  TS-1101-C-W  [SW-SMD_L6.0-W3.3-LS8.0]  119.89 50.57 0 top
C14  10uF  [C0805]  70.36 26.95 180 top
C15  TS-1101-C-W  [SW-SMD_L6.0-W3.3-LS8.0]  119.89 44.73 0 top
C27  470uF  [CAP-TH_BD10.0-P5.00-D1.0-FD]  8 50.06 180 top
C31  4.7uF  [C0805]  21.59 47.37 180 top
C32  4.7uF  [C0805]  21.54 45.21 180 top
C33  4.7uF  [C0805]  21.53 49.4 180 top
C34  4.7uF  [C0805]  21.52 43.05 180 top
C35  620pF  [C0805]  14.29 35.14 270 top
C36  43pF  [C0805]  16.65 35.03 270 top
C37  1UF  [C0805]  25.7 35.94 270 top
C38  47uF  [CAP-SMD_L3.5-W2.8-R-RD]  19.84 25.73 0 top
C52  10uF  [CAP-SMD_L3.5-W2.8-R-RD]  107.06 13.99 270 bottom
C53  10uF  [CAP-SMD_L3.5-W2.8-R-RD]  116.45 20.07 270 bottom
C62  100nF  [C0805]  23.51 29.78 270 top
C63  100nF  [C0805]  25.79 29.84 270 top
C64  100nF  [C0805]  25.82 24.51 90 top
C67  10uF  [CAP-SMD_L3.5-W2.8-R-RD]  50.55 56.42 90 bottom
C68  10uF  [CAP-SMD_L3.5-W2.8-R-RD]  56.77 65.55 270 bottom
C70  22uF  [CAP-SMD_L3.2-W1.6]  66.23 11.71 180 bottom
C73  22uF  [CAP-SMD_L3.2-W1.6]  90.93 7.52 0 bottom
C81  22uF  [CAP-SMD_L3.2-W1.6]  73.28 7.52 0 bottom
CN7  AM-1015B-M  [CONN-TH_AM-1015B-M]  8.51 21.61 270 top
D6  SS86  [SMC_L6.9-W5.9-LS7.9-RD]  24.93 35.88 180 bottom
H3  -  [HDR-TH_6P-P2.54-V-F-R2-C3-S2.54]  106.93 61.36 180 top
H8  -  [HDR-TH_4P-P2.54-V-M-R2-C2-S2.54-1]  62.87 62.63 0 top
H9  -  [HDR-TH_4P-P2.54-V-M-R2-C2-S2.54-1]  27.18 59.84 0 top
H62  -  [HDR-TH_6P-P2.54-V-F-R2-C3-S2.54]  42.8 11.33 0 top
L3  15uH  [IND-SMD_L7.1-W6.6]  25.91 28.85 180 bottom
LED8  NCD0805R1  [LED0805-R-RD]  16.17 44.45 90 top
LED10  NCD0805R1  [LED0805-RD]  115.49 12.68 0 top
LED11  NCD0805R1  [LED0805-RD]  46.78 68.22 0 top
LED12  NCD0805R1  [LED0805-RD]  20.83 19.45 180 top
LED15  NCD0805R1  [LED0805-RD]  77.6 6.88 180 top
LED16  NCD0805R1  [LED0805-RD]  96.09 7.73 180 top
P3  KF301-5.0-2P  [CONN-TH_P5.00_KF301-5.0-2P]  17.02 7.9 0 top
P4  KF301-5.0-2P  [CONN-TH_P5.00_KF301-5.0-2P]  11.6 61.36 180 top
Q1  S8050  [SOT-23-3_L2.9-W1.3-P1.90-LS2.4-BR]  85.85 32.03 270 top
Q2  AMS1117-3.3V  [SOT-89-3_L4.5-W2.5-P1.50-LS4.2-BR]  112.22 13.4 270 bottom
Q7  AMS1117-3.3V  [SOT-89-3_L4.5-W2.5-P1.50-LS4.2-BR]  55.25 56.92 180 bottom
R2  10R  [R0805]  84.69 45.52 0 top
R3  4.7K  [R0805]  86.06 28.79 180 top
R4  10K  [R0805]  89.66 29.78 90 top
R8  10K  [R0805]  70.33 24.62 180 top
R33  1kΩ  [R0805]  16.21 48.91 90 top
R34  0Ω  [R0805]  14.46 39.69 270 top
R37  10kΩ  [R0805]  15.61 28.64 0 top
R38  75kΩ  [R0805]  16.83 39.63 270 top
R39  18.7kΩ  [R0805]  15.58 31.06 0 top
R40  52.3kΩ  [R0805]  20.35 28.72 180 top
R48  4.7K  [R0805]  99.82 45.62 0 top
R50  0Ω  [R0805]  15.46 21.17 0 top
R51  0Ω  [R0805]  15.43 14.32 0 top
R52  0Ω  [R0805]  15.43 18.91 0 top
R53  0Ω  [R0805]  17.59 55.77 0 top
R54  0Ω  [R0805]  15.43 16.64 0 top
R55  0Ω  [R0805]  17.59 53.35 0 top
R62  4.7K  [R0805]  20.72 22.24 0 top
R65  4.7K  [R0805]  73.09 6.88 180 top
R66  4.7K  [R0805]  51.53 68.22 0 top
R67  2.2K  [R0805]  116.52 16.29 90 top
R68  4.7K  [R0805]  91.06 7.64 180 top
SCREW5  -  [M3螺丝]  3.3 3.45 0 top
SCREW6  -  [M3螺丝]  3.3 67.71 0 top
SCREW7  -  [M3螺丝]  123.32 3.45 0 top
SCREW8  -  [M3螺丝]  123.32 67.71 0 top
SW6  KF1001-03P-R0-GL-DFT-01B  [SW-TH_6P-L9.9-W9.0-P2.54-LS7.6]  111 5.86 270 top
SW7  MT-0-103-A101-M200-RS+PJ  [SW-TH_MT-0-103-A101-M200-RS]  8.51 36.73 90 top
U1  TPS54540DDAR  [SOIC-8_L4.9-W3.9-P1.27-LS6.0-BL-EP]  21.27 36 180 top
U6  -  [AUFE_RT1064]  86.74 35.33 0 top
U29  B4B-XH-A(LF)(SN)  [CONN-TH_B4B-XH-A-LF-SN]  75.69 11.83 0 top
U31  B4B-XH-A(LF)(SN)  [CONN-TH_B4B-XH-A-LF-SN]  93.6 11.83 0 top
屏幕1  WAFER-XH2.54-8PZZ  [CONN-TH_8P-P2.50-XH2.54-8P]  121.03 23.77 90 top
无线串口1  -  [HDR-TH_8P-P2.54-V-F-R2-C4-S2.54-1]  57.78 11.45 180 top
编码器1  67997-206HLF  [HDR-TH_6P-P2.54-V-M-R2-C3-S2.54-1]  70.49 61.74 270 top
编码器2  67997-206HLF  [HDR-TH_6P-P2.54-V-M-R2-C3-S2.54-1]  80.01 61.62 270 top
编码器3  67997-206HLF  [HDR-TH_6P-P2.54-V-M-R2-C3-S2.54-1]  88.39 61.74 270 top
编码器4  67997-206HLF  [HDR-TH_6P-P2.54-V-M-R2-C3-S2.54-1]  96.9 61.74 270 top
陀螺仪1  WAFER-XH2.54-8PZZ  [CONN-TH_8P-P2.50-XH2.54-8P]  43.81 63.01 180 top

## Footprints (pads in the part's own frame, mm; a bottom-side part is the same pattern mirrored in y, then rotated)
AUFE_RT1064
  round 1.5 hole 0.9x0.9: 1(-24.13,-16.51) 2(-24.13,-13.97) 3(-21.59,-16.51) 4(-21.59,-13.97) 5(-19.05,-16.51) 6(-19.05,-13.97) 7(-16.51,-16.51) 8(-16.51,-13.97) 9(-13.97,-16.51) 10(-13.97,-13.97) 11(-11.43,-16.51) 12(-11.43,-13.97) 13(-8.89,-16.51) 14(-8.89,-13.97) 15(-6.35,-16.51) 16(-6.35,-13.97) 17(-3.81,-16.51) 18(-3.81,-13.97) 19(-1.27,-16.51) 20(-1.27,-13.97) 21(1.27,-16.51) 22(1.27,-13.97) 23(3.81,-16.51) 24(3.81,-13.97) 25(6.35,-16.51) 26(6.35,-13.97) 27(8.89,-16.51) 28(8.89,-13.97) 29(11.43,-16.51) 30(11.43,-13.97) 31(13.97,-16.51) 32(13.97,-13.97) 33(16.51,-16.51) 34(16.51,-13.97) 35(19.05,-16.51) 36(19.05,-13.97) 37(21.59,-16.51) 38(21.59,-13.97) 39(24.13,-16.51) 40(24.13,-13.97) 41(21.59,-11.43) 42(24.13,-11.43) 43(24.13,11.43) 44(21.59,11.43) 45(24.13,13.97) 46(24.13,16.51) 47(21.59,13.97) 48(21.59,16.51) 49(19.05,13.97) 50(19.05,16.51) 51(16.51,13.97) 52(16.51,16.51) 53(13.97,13.97) 54(13.97,16.51) 55(11.43,13.97) 56(11.43,16.51) 57(8.89,13.97) 58(8.89,16.51) 59(6.35,13.97) 60(6.35,16.51) 61(3.81,13.97) 62(3.81,16.51) 63(1.27,13.97) 64(1.27,16.51) 65(-1.27,13.97) 66(-1.27,16.51) 67(-3.81,13.97) 68(-3.81,16.51) 69(-6.35,13.97) 70(-6.35,16.51) 71(-8.89,13.97) 72(-8.89,16.51) 73(-11.43,13.97) 74(-11.43,16.51) 75(-13.97,13.97) 76(-13.97,16.51) 77(-16.51,13.97) 78(-16.51,16.51) 79(-19.05,13.97) 80(-19.05,16.51) 81(-21.59,13.97) 82(-21.59,16.51) 83(-24.13,13.97) 84(-24.13,16.51)
BUZ-TH_BD9.0-P5.00-D0.6-FD
  round 1.8 hole 1: 1(-2.5,0) 2(2.5,0)
C0805
  rect 1.41x1.35 smd: 1(-1,0) 2(1,0)
CAP-SMD_L3.2-W1.6
  rect 1.2x1.4 smd: 1(-1.35,0) 2(1.35,0)
CAP-SMD_L3.5-W2.8-R-RD
  rect 1.9x2.376 smd: 1(1.899,0) 2(-1.899,0)
CAP-TH_BD10.0-P5.00-D1.0-FD
  round 1.6 hole 1: 1(-2.54,0) 2(2.54,0)
CONN-TH_8P-P2.50-XH2.54-8P
  round 2 hole 1.1: 1(8.75,0) 2(6.25,0) 3(3.75,0) 4(1.25,0) 5(-1.25,0) 6(-3.75,0) 7(-6.25,0) 8(-8.75,0)
CONN-TH_AM-1015B-M
  oval 3.5x5.5 hole 2.5x4.5: 1(-3.231,-0.029)
  oval 5.5x3.5 hole 4.5x2.5: 2(3.231,0.029)
CONN-TH_B4B-XH-A-LF-SN
  round 1.7 hole 1: 1(3.75,0) 2(1.25,0) 3(-1.25,0) 4(-3.75,0)
CONN-TH_P5.00_KF301-5.0-2P
  round 2.2 hole 1.4: 1(-2.5,0) 2(2.5,0)
HDR-TH_4P-P2.54-V-M-R2-C2-S2.54-1
  rect 1.524x1.524 hole 0.914: 1(-1.27,-1.27)
  round 1.524 hole 0.914: 2(-1.27,1.27) 3(1.27,-1.27) 4(1.27,1.27)
HDR-TH_6P-P2.54-V-F-R2-C3-S2.54
  rect 1.7x1.6 hole 1: 1(-2.54,-1.27)
  round 1.6 hole 1: 2(-2.54,1.27) 3(0,-1.27) 4(0,1.27) 5(2.54,-1.27) 6(2.54,1.27)
HDR-TH_6P-P2.54-V-M-R2-C3-S2.54-1
  rect 1.8x1.8 hole 1.05: 1(-2.54,-1.27)
  round 1.8 hole 1.05: 2(-2.54,1.27) 3(0,-1.27) 4(0,1.27) 5(2.54,-1.27) 6(2.54,1.27)
HDR-TH_8P-P2.54-V-F-R2-C4-S2.54-1
  rect 1.6x1.6 hole 1.1: 1(-3.81,-1.27)
  round 1.6 hole 1.1: 2(-3.81,1.27) 3(-1.27,-1.27) 4(-1.27,1.27) 5(1.27,-1.27) 6(1.27,1.27) 7(3.81,-1.27) 8(3.81,1.27)
IND-SMD_L7.1-W6.6
  rect 2.15x3.32 smd: 1(-2.913,0) 2(2.913,0)
LED0805-R-RD
  rect 1x1.399 smd: 1(1.05,0) 2(-1.05,0)
LED0805-RD
  rect 1x1.25 smd: 1(-1.1,0) 2(1.1,0)
M3螺丝
  round 3.2 hole 3.2: 1(0,0)
R0805
  rect 1.133x1.377 smd: 1(-1,0) 2(1,0)
SMC_L6.9-W5.9-LS7.9-RD
  rect 2.7x3.3 smd: 1(-3.687,0) 2(3.687,0)
SOIC-8_L4.9-W3.9-P1.27-LS6.0-BL-EP
  oval 0.602x1.941 smd: 1(-1.905,-2.72) 2(-0.635,-2.72) 3(0.635,-2.72) 4(1.905,-2.72) 5(1.905,2.72) 6(0.635,2.72) 7(-0.635,2.72) 8(-1.905,2.72)
  rect 3.098x2.41 smd: 9(0,0)
SOT-23-3_L2.9-W1.3-P1.90-LS2.4-BR
  rect 1.25x0.7 smd: 1(1,-0.95) 2(1,0.95) 3(-1,0)
SOT-89-3_L4.5-W2.5-P1.50-LS4.2-BR
  rect 1.575x0.672 smd: 1(1.356,-1.5) 3(1.356,1.5)
  custom 5.377x1.9 smd: 2(-1.356,0)
SW-SMD_L6.0-W3.3-LS8.0
  rect 1.9x1.5 smd: 1(-4,0) 2(4,0)
SW-TH_6P-L9.9-W9.0-P2.54-LS7.6
  rect 1.524x1.6 hole 1: 1(-2.54,-3.809)
  round 1.6 hole 1: 2(0,-3.81) 3(2.54,-3.81) 4(2.54,3.81) 5(0,3.81) 6(-2.54,3.81)
SW-TH_MT-0-103-A101-M200-RS
  rect 1.8x3 hole 1.2x2.5: 1(-4.7,0)
  oval 1.8x3 hole 1.2x2.5: 2(0,0) 3(4.7,0)

## Nets
As in the schematic.

Pads without a net: SCREW5 1; SCREW6 1; SCREW7 1; SCREW8 1; U1 3; U6 3 4 7 8 21 22 37 50 52 69; 无线串口1 2 8; 编码器1 5 6; 编码器2 5 6; 编码器3 5 6; 编码器4 5 6; 陀螺仪1 1 2

## Via types
v1: diameter 0.61, hole 0.305, Top Layer to Bottom Layer, 82 vias
v2: diameter 1.524, hole 0.762, Top Layer to Bottom Layer, 4 vias

## Routing (per net, layer and track width the routed paths; a pad name or vN(x,y) marks a point on that pad's centre or on a via; arc(x,y) is an arc through that point)
3V3: length 122.4
  Top Layer w0.381: R48.1 98.81,45.63 98.81,46.5 98.3,47.01 84.07,47.01 83.69,46.63 R2.1
  Top Layer w0.762: R2.1 83.54,45.36 v2(80.77,45.36)
  Bottom Layer w0.762: Q7.2 56.77,57.09 C68.1 60.59,63.66 ; 60.59,63.66 61.35,63.66 H8.2 H8.4 64.13,65.3 66.29,67.46 81.58,67.46 ; 60.59,63.66 59.69,62.76 59.69,46.5 60.83,45.36 v2(80.77,45.36) ; 81.58,67.46 89.68,67.46 ; 81.58,67.46 81.28,67.16 编码器2.2 ; 89.68,67.46 97.03,67.46 98.17,66.32 编码器4.2 ; 89.68,67.46 89.66,67.44 编码器3.2 ; 编码器1.2 71.75,67.46
3V31: length 16.6
  Top Layer w0.254: 屏幕1.7 116.75,17.52 R67.2
  Bottom Layer w0.762: 屏幕1.7 120.38,18.17 C53.1 116.46,18.16 116.46,15.64 115.57,14.76 Q2.2
GNDBAT:
  vias: v1(1.78,43.33) v1(1.78,42.57) v1(1.78,41.81) v1(1.91,29.49) v1(1.91,28.72) v1(1.91,27.96) v1(2.54,43.33) v1(2.54,42.57) v1(2.54,41.81) v1(2.67,29.49) v1(2.67,28.72) v1(2.67,27.96) v1(3.3,43.33) v1(3.3,42.57) v1(3.3,41.81) v1(3.43,29.49) v1(3.43,28.72) v1(3.43,27.96) v1(11.18,68.98) v1(11.18,68.22) v1(11.18,67.46) v1(11.94,68.98) v1(11.94,68.22) v1(11.94,67.46) v1(12.7,68.98) v1(12.7,68.22) v1(12.7,67.46) v1(16.4,41.92) v1(17.21,44.11) v1(17.21,43.37) v1(17.21,42.63) v1(17.21,41.92) v1(17.91,4.34) v1(17.91,3.58) v1(17.91,2.82) v1(18.03,44.09) v1(18.03,43.33) v1(18.03,42.59) v1(18.03,41.8) v1(18.67,4.34) v1(18.67,3.58) v1(18.67,2.82) v1(18.8,44.09) v1(18.8,43.33) v1(18.8,42.57) v1(18.8,41.83) v1(19.43,4.34) v1(19.43,3.58) v1(19.43,2.82) v1(24.38,49.81) v1(24.38,49.13) v1(24.38,48.33) v1(24.38,47.63) v1(24.38,46.93) v1(24.38,46.16) v1(24.38,45.29) v1(24.38,44.49) v1(24.38,43.77) v1(24.38,42.95) v1(24.38,42.06) v1(24.38,41.16) v1(24.38,40.41)
VCC5V: length 224.8
  Top Layer w0.254: R68.2 89.85,7.85 U31.4 ; R66.2 52.53,63.05 陀螺仪1.8 ; R65.2 71.94,7.02 U29.4
  Top Layer w0.508: C38.1 21.72,25.71 R62.2
  Top Layer w1.27: v2(32.39,21.99) 29.84,24.53 29.84,26.31 ; U6.6 U6.5 ; 29.84,26.95 29.84,26.57 29.72,26.44 ; 29.84,26.95 29.84,57.17 H9.3 H9.1 ; 29.84,26.95 29.72,26.44 ; 29.72,26.44 28.79,25.51 C64.2
  Bottom Layer w1.27: U31.4 89.85,5.18 89.77,5.1 ; 72.02,5.1 71.94,5.18 U29.4 ; 72.02,5.1 67.71,5.1 ; 72.02,5.1 89.77,5.1 ; 陀螺仪1.8 52.71,62.87 52.71,58.57 ; 110.72,12.05 110.55,12.22 105.16,12.22 104.01,11.07 104.01,6.12 103,5.1 89.77,5.1 ; 50.16,12.72 50.17,12.72 53.97,12.72 ; 50.16,12.72 50.16,19.58 47.75,21.99 v2(32.39,21.99) ; 50.16,12.72 50.16,8.66 53.72,5.1 67.71,5.1 ; Q7.3 53.79,58.32 C67.1 50.3,58.57 H9.3 ; 67.71,5.1 67.69,5.12 U6.5
  vias: v2(22.75,28.48)
VCCBAT: length 65.3
  Top Layer w1.27: U1.2 21.9,40.6 20.53,41.98 20.53,49.22 19.69,50.06 10.54,50.06
  Bottom Layer w2.54: 10.54,50.06 10.67,50.06 13.84,46.89 13.84,8.53 14.48,7.9 P3.1
B0: length 42.9
  Top Layer w0.254: U6.23 91.82,20.09 91.82,25.93 92.46,26.57 116.84,26.57 117.6,25.8 117.6,20.6 118.24,19.96 120.97,19.96 屏幕1.6
B1: length 39.2
  Top Layer w0.254: 屏幕1.5 121.01,22.5 118.75,22.5 118.24,23.01 118.24,25.93 117.09,27.07 91.57,27.07 90.55,26.06 U6.24
B2: length 33.1
  Top Layer w0.254: v1(116.33,25.17) 95.25,25.17 94.36,24.28 94.36,20.09 U6.25
  Bottom Layer w0.254: 屏幕1.4 120.88,25.17 v1(116.33,25.17)
B3: length 34.7
  Top Layer w0.254: U6.26 93.09,25.17 93.9,25.98 v1(115.7,25.98)
  Bottom Layer w0.254: v1(115.7,25.98) 118.54,25.98 119.25,26.69 119.25,28.24 屏幕1.2
B11: length 39.3
  Top Layer w0.254: U6.47 106.68,47.65 106.68,44.35 105.79,43.46 92.07,43.46 91.24,42.62 91.24,29.67 91.06,29.49 90.37,29.49 R4.1
  Top Layer w0.381: R3.1 89.65,28.79 R4.1
B12_TX: length 24.4
  Top Layer w0.254: U29.1 79.44,14.19 80.65,15.39 97.16,15.39 98.17,16.41 U6.29
B13_RX: length 24.6
  Top Layer w0.254: U29.2 76.94,13.08 80.01,16.15 87.5,16.15 87.68,16.33 87.68,16.86 87.86,17.04 88,17.04 88.18,16.86 88.18,16.33 88.36,16.15 94.49,16.15 95.63,17.29 U6.27
B16: length 44
  Top Layer w0.254: 编码器4.3 95.63,61.49 96.65,60.47 99.19,60.47 99.44,60.22 v1(99.44,47.14)
  Bottom Layer w0.254: U6.32 99.44,22.63 v1(99.44,47.14)
B17: length 46.5
  Top Layer w0.254: v1(101.85,46.63) 101.85,60.73 100.84,61.74 编码器4.4
  Bottom Layer w0.254: v1(101.85,46.63) 101.85,19.96 U6.31
B18_TX: length 16.5
  Top Layer w0.254: U31.1 103.12,11.83 104.52,13.23 104.52,20.22 103.38,21.36 U6.34
B19_RX: length 16.5
  Top Layer w0.254: U6.33 103.25,16.64 103.07,16.46 102.67,16.46 102.49,16.28 102.49,16.13 102.67,15.95 103.07,15.95 103.25,15.77 103.25,15.62 103.07,15.44 102.67,15.44 102.49,15.26 102.49,15.11 102.67,14.93 103.07,14.93 103.25,14.75 103.25,13.74 102.49,12.98 95.99,12.98 U31.2
C0: length 13.1
  Bottom Layer w0.254: U6.82 65.15,60.22 66.68,61.74 编码器1.3
C1: length 17
  Bottom Layer w0.254: 编码器1.4 70.49,60.47 67.31,60.47 66.42,59.59 66.42,50.57 U6.79
C2: length 19.6
  Bottom Layer w0.254: U6.80 67.69,56.79 68.71,57.81 76.71,57.81 76.96,58.06 76.96,60.73 77.85,61.62 编码器2.3
C3: length 27.2
  Bottom Layer w0.254: U6.77 71.37,50.44 71.37,56.66 72.14,57.43 83.95,57.43 85.09,58.57 85.09,60.98 85.98,61.87 87,61.87 编码器3.3
C12: length 44
  Bottom Layer w0.254: v1(115.7,61.87) 115.7,57.55 114.81,56.66 81.79,56.66 80.39,55.27 U6.70
C13: length 41.4
  Bottom Layer w0.254: U6.67 84.2,50.57 84.2,54 85.6,55.39 114.81,55.39 115.82,54.38 v1(115.82,50.82)
C14: length 36.3
  Bottom Layer w0.254: v1(115.82,56.03) 84.2,56.03 82.93,54.76 U6.68
C15: length 43.3
  Bottom Layer w0.254: v1(115.7,44.73) 114.43,46 114.43,53.87 113.54,54.76 87.76,54.76 86.74,53.74 86.74,50.31 85.72,49.3 U6.65
C18: length 54.7
  Bottom Layer w0.254: U6.64 88.01,53.24 88.9,54.12 112.9,54.12 113.92,53.11 113.92,33.93 114.43,33.42 120.89,33.42 121.03,33.28
C19: length 58.5
  Top Layer w0.254: 屏幕1.3 120.84,27.71 v1(113.66,27.71)
  Bottom Layer w0.254: U6.61 91.69,50.44 91.69,52.85 92.2,53.36 112.27,53.36 113.28,52.35 113.28,28.09 v1(113.66,27.71)
C20: length 60
  Top Layer w0.254: 陀螺仪1.3 40.06,56.35 42.29,54.12 89.92,54.12 90.55,53.49 U6.62
C21: length 62.4
  Top Layer w0.254: 陀螺仪1.4 42.56,56.52 43.94,55.14 91.31,55.14 91.95,54.51 91.95,50.44 U6.59
C22: length 58
  Top Layer w0.254: 陀螺仪1.5 45.06,57.32 46.35,56.03 92.2,56.03 93.22,55.01 93.22,51.97 U6.60
C23: length 59.9
  Top Layer w0.254: 陀螺仪1.6 47.56,58.12 48.77,56.92 93.6,56.92 94.49,56.03 94.49,50.44 U6.57
C24: length 22
  Top Layer w0.254: U6.58 95.63,56.03 94.11,57.55 84.33,57.55 83.19,58.7 83.19,60.73 82.3,61.62 编码器2.4
C25: length 17.8
  Top Layer w0.254: U6.55 96.77,50.7 96.77,56.28 94.62,58.44 92.2,58.44 91.44,59.2 91.44,60.6 90.3,61.74 编码器3.4
C26: length 51.3
  Top Layer w0.254: 107.19,8.41 106.93,8.66 v1(106.93,24.41)
  Bottom Layer w0.254: U6.56 98.17,51.46 99.06,50.57 106.17,50.57 106.93,49.81 v1(106.93,24.41)
C27: length 56
  Top Layer w0.254: SW6.2 108.59,5.86 109.6,6.88 v1(109.6,22.5) ; R48.2 100.82,49.19 U6.53
  Bottom Layer w0.254: U6.53 100.71,48.92 101.85,47.77 105.28,47.77 106.35,46.71 106.35,23.47 107.06,22.76 109.35,22.76 v1(109.6,22.5)
CR: length 2.3
  Top Layer w0.254: R8.2 69.36,24.64 C14.2
D0: length 39.4
  Top Layer w0.254: U6.14 76.58,20.09 76.58,17.17 75.69,16.28 46.35,16.28 45.34,15.26 H62.6
D1: length 39.4
  Top Layer w0.254: U6.13 77.85,16.53 76.96,15.64 47.62,15.64 46.86,14.88 46.86,11.58 H62.5
D2: length 41.7
  Top Layer w0.254: U6.12 74.04,20.09 74.04,18.31 73.28,17.55 41.91,17.55 40.26,15.9 H62.2
D3: length 41.5
  Top Layer w0.254: H62.1 41.53,11.33 41.53,15.77 42.67,16.91 73.79,16.91 75.31,18.44 U6.11
D12: length 79.3
  Top Layer w0.254: H3.6 104.39,59.71 105.92,58.19 111.89,58.19 112.78,57.3 112.78,31.01 112.4,30.63 v1(93.22,30.63)
  Bottom Layer w0.254: U6.15 81.43,19.86 81.43,29.77 82.3,30.63 v1(93.22,30.63)
D13: length 80.3
  Top Layer w0.254: H3.5 103.25,61.49 103.25,58.82 104.78,57.3 111.51,57.3 112.27,56.54 112.27,32.15 111.51,31.39 v1(93.22,31.39)
  Bottom Layer w0.254: v1(93.22,31.39) 81.53,31.39 80.26,30.12 80.26,21.49 U6.16
D14: length 75.3
  Top Layer w0.254: H3.2 111.51,60.09 113.66,57.93 113.66,30.88 112.65,29.87 v1(93.22,29.87)
  Bottom Layer w0.254: U6.17 81.9,19.85 81.9,28.97 82.8,29.87 v1(93.22,29.87)
D15: length 74.9
  Top Layer w0.254: v1(93.22,29.11) 113.16,29.11 114.3,30.25 114.3,60.35 112.01,62.63 H3.1
  Bottom Layer w0.254: v1(93.22,29.11) 83.82,29.11 82.93,28.22 U6.18
D16: length 27.9
  Top Layer w0.254: 61.59,12.72 61.59,13.99 61.98,14.37 77.34,14.37 79.88,16.91 84.84,16.91 85.47,17.55 U6.19
D17: length 32.3
  Top Layer w0.254: U6.20 84.2,20.09 84.2,17.93 83.69,17.42 79.63,17.42 77.22,15.01 59.56,15.01 59.06,14.5 59.06,12.72
D26: length 47
  Top Layer w0.254: U6.84 62.48,51.97 v1(58.17,51.97)
  Bottom Layer w0.254: v1(58.17,51.97) 57.78,51.58 57.78,11.45 无线串口1.4
D27: length 89
  Top Layer w0.254: U6.81 65.15,25.17 v1(63.75,23.77) ; v1(63.75,13.23) 63.75,4.85 64.9,3.71 106.68,3.71 107.06,3.32
  Bottom Layer w0.254: v1(63.75,23.77) v1(63.75,13.23)
$1N4191: length 2.3
  Top Layer w0.381: R3.2 85.06,30.87 Q1.1
$1N4192: length 3.8
  Top Layer w0.762: BUZZER3.2 85.72,33.15 Q1.3
$1N4364: length 3.8
  Top Layer w0.762: BUZZER3.1 85.69,41.8 R2.2
$1N4371: length 2.6
  Top Layer w0.381: U1.4 19.27,38.63 R38.2
$1N4372: length 3.3
  Top Layer w0.762: C37.1 23.91,38.72 U1.1
$1N4373: length 5.5
  Top Layer w0.762: v2(27.94,35.07) 27.8,34.94 C37.2 24.04,33.28 U1.8
$1N4374: length 9.3
  Top Layer w0.381: R39.2 16.65,31.14 C36.2 ; U1.6 v1(20.63,31.01)
  Bottom Layer w0.381: v1(20.63,31.01) v1(16.64,31.01)
$1N4375: length 3.2
  Top Layer w0.381: R39.1 14.58,33.86 C35.2
$1N4376: length 7.3
  Top Layer w0.381: U1.5 19.35,33.27 R40.2 19.28,28.64 R37.2
$1N4399: length 6.4
  Top Layer w0.254: R8.1 71.33,20.26 U6.9
$1N4411: length 2.4
  Top Layer w0.508: R33.1 16.21,45.54 LED8.1
$1N4451: length 2.8
  Top Layer w0.508: LED12.2 19.72,19.46 R62.1
$1N4463: length 2.4
  Top Layer w0.254: LED15.2 76.49,6.88 R65.1
$1N4464: length 2.7
  Top Layer w0.254: R66.1 47.88,68.22
$1N4466: length 2.6
  Top Layer w0.254: R67.1 116.59,15.23 LED10.2
$1N4492: length 3
  Top Layer w0.254: R68.1 94.91,7.64 LED16.2

## Copper pours and planes (outline as drawn; the poured copper is in the pictures)
GND on Top Layer: -2.54,79.02 132.59,79.02 132.59,-6.84 -2.54,-6.84
GND on Bottom Layer: -7.62,84.73 140.97,84.73 140.97,-16.87 -7.62,-16.87
GNDBAT on Top Layer: -4.19,72.67 17.65,72.67 17.65,51.97 17.53,51.84 25.15,51.84 25.27,51.97 25.27,39.65 13.21,39.65 13.21,26.57 13.34,26.44 15.49,26.44 15.49,12.47 25.91,12.47 26.03,12.6 26.03,-2.77 26.16,-2.9 -3.81,-2.9 -4.19,-2.52
GNDBAT on Bottom Layer: -4.06,73.3 17.65,73.3 17.65,51.67 25.27,51.67 25.27,39.65 25.15,39.52 13.59,39.52 13.34,39.27 13.34,24.19 15.43,22.09 15.43,13.04 15.37,12.98 26.8,12.98 26.8,-5.18 26.03,-5.95 -3.94,-5.95 -5.21,-4.68 -5.21,72.16
VCC5V on Top Layer: 20.35,29.84 27.05,29.84 27.05,24.41 20.35,24.41
VCCBAT on Top Layer: 6.93,51.2 12.51,51.2 12.51,35.08 6.93,35.08
VCCBAT on Top Layer: 6.86,64.16 11.71,64.16 11.71,48.87 6.86,48.87
$1N4373 on Bottom Layer: 27.18,37.74 30.48,37.74 30.48,26.95 27.18,26.95
$1N4494 on Top Layer: 5.54,34.04 11.93,34.04 11.93,22.17 5.54,22.17

Small or netless copper shapes (teardrops, artwork), in the pictures only: 138 on Top Layer, 87 on Bottom Layer

## Text on the board
Top Silkscreen Layer: D13 GND D15 / D12 GND D14 | D3 GND D1 | D2 GND D0 | 5V,GND,D17,D16 | GND,D26 | 5V,G,B13RX,B12TX | 5V,G,B19RX,B18TX | GND3V3 | C0 C1 | C2C24 | C3C25 | B16B17 | GND | 5V | 3V3 | ON | 正 | 负 | 驱动接口 | 开 | 关 | 电机信号
